# Altium schematic sheet AntiAliasing_Bessel.SchDoc
size A4; SheetNumber: 3; SheetTotal: 4
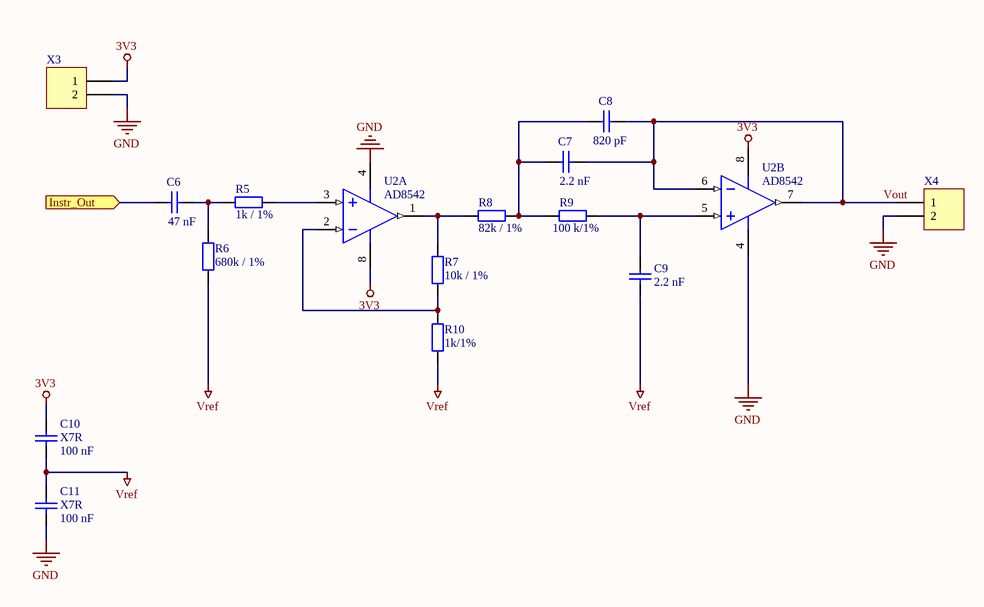
[diagram p0: AntiAliasing_Bessel.SchDoc]

## Parts
C6  47 nF  [C0805]
C7  2.2 nF  [C0805]
C8  820 pF  [C0805]
C9  2.2 nF  [C0805]
C10  X7R  value 100 nF  [C0805]
C11  X7R  value 100 nF  [C0805]
R5  1k / 1%  [6-0805_N]
R6  680k / 1%  [6-0805_N]
R7  10k / 1%  [6-0805_N]
R8  82k / 1%  [6-0805_N]
R9  100 k/1%  [6-0805_N]
R10  1k/1%  [6-0805_N]
U2  AD8542  [ADI-R-8_M]  (parts A,B of 2)
X3  Header 2  [HDR1X2]  (value not drawn)
X4  Header 2  [HDR1X2]  (value not drawn)

## Ports
Instr_Out (in, see Top[2C], Instr_pojacalo[3B])

## Nets
3V3: C10.2 U2.8(+V) X3.1
GND: C11.1 U2.4(-V) X3.2 X4.2
Vref: C9.1 C10.1 C11.2 R6.1 R10.1
Instr_Out: C6.1 ; port Instr_Out
Vout: C7.1 C8.1 U2.6(-IN_B) U2.7(OUT_B) X4.1
NetC6_2: C6.2 R5.1 R6.2
NetC7_2: C7.2 C8.2 R8.2 R9.1
NetC9_2: C9.2 R9.2 U2.5(+IN_B)
NetR5_2: R5.2 U2.3(+IN_A)
NetR7_1: R7.1 R10.2 U2.2(-IN_A)
NetR7_2: R7.2 R8.1 U2.1(OUT_A)

## Library data of the parts
C6 = Cap: Capacitor; Proizvođač: KEMET; Kataloški broj: C0805C473M3GECAUTO7210; Cijena: 0,34 €; Kućište: 0805; Opis: Keramički kondenzator, 47 nF, 25V, C0G; Value: 47 nF
C7 C9 = Cap: Capacitor; Proizvođač: Murata Electronics; Kataloški broj: GRM2165C1H222JA01D; Cijena: 0,16 €; Kućište: 0805; Opis: Keramički kondenzator, 2.2 nF, 50V, C0G; Value: 2.2 nF
C8 = Cap: Capacitor; Proizvođač: Murata Electronics; Kataloški broj: GRM2165C1H821JA01D; Cijena: 0,18 €; Kućište: 0805; Opis: Keramički kondenzator, 820 pF, 50V, C0G; Value: 820 pF
C10 C11 = Cap: Capacitor; Proizvođač: Murata Electronics; Kataloški broj: GCM21BR71H104KA37L; Cijena: 0,28 €; Kućište: 0805; Opis: Keramički kondenzator, 100 nF, 50V, X7R
R5 = Res2: Resistor; Proizvođač: Vishay; Kataloški broj: CRCW08051K00FKEA; Cijena: 0,09 €; Kućište: 0805; Opis: Otpornik, 1 k, 1%; Value: 1k / 1%
R6 = Res2: Resistor; Proizvođač: Vishay; Kataloški broj: CRCW0805680KFKEA; Cijena: 0,09 €; Kućište: 0805; Opis: Otpornik, 680 k, 1%; Value: 680k / 1%
R7 = Res2: Resistor; Proizvođač: Vishay; Kataloški broj: CRCW080510K0FKEA; Cijena: 0,09 €; Kućište: 0805; Opis: Otpornik, 10 k, 1%; Value: 10k / 1%
R8 = Res2: Resistor; Proizvođač: Vishay; Kataloški broj: CRCW080582K0FKEA; Cijena: 0,09 €; Kućište: 0805; Opis: Otpornik, 82 k, 1%; Value: 82k / 1%
R9 = Res2: Resistor; Proizvođač: Vishay; Kataloški broj: CRCW0805100KFKEA; Cijena: 0,10 €; Kućište: 0805; Opis: Otpornik, 100 k, 1%; Value: 100 k/1%
R10 = Res2: Resistor; Proizvođač: Vishay; Kataloški broj: CRCW080510K0FKEA; Cijena: 0,09 €; Kućište: 0805; Opis: Otpornik, 10 k, 1%; Value: 10k / 1%
U2 = CMP-0384-00597-1: Double Channel RRIO Operational Amplifier, 1 MHz BW, 920 mV/us SR, Industrial, 8-pin SOIC (R-8), Tube; Proizvođač: Analog Devices; Kataloški broj: AD8542ARZ; Cijena: 1,31 €; Kućište: SOIC-8; Opis: Dvostruko operacijsko pojačalo
X3 X4 = Header 2: Header, 2-Pin; Proizvođač: Molex; Kataloški broj: 90120-0122; Cijena: 0,34 €; Kućište: THT Pin Header 2.54mm; Opis: Muški konektor 1x2, 2.54mm